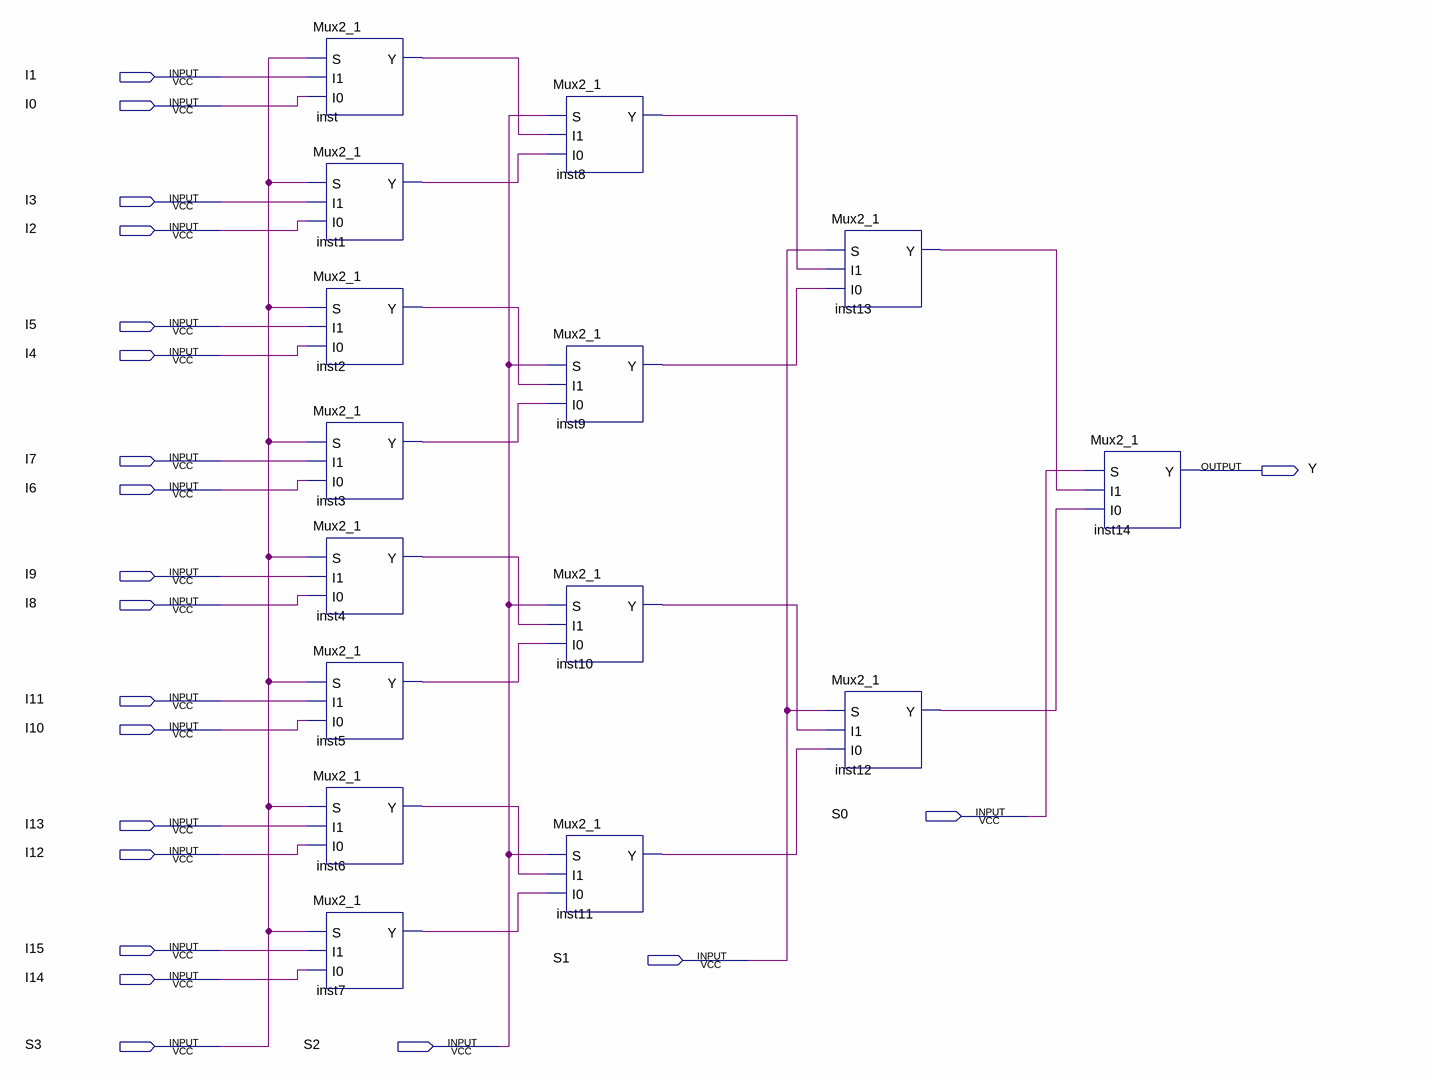
[diagram p0: schematic sheet]
// Quartus schematic Mux16_1.bdf as structural Verilog: 15 symbols, 21 pins
module Mux16_1 (
  input  I1,
  input  I0,
  input  I3,
  input  I2,
  input  I5,
  input  I4,
  input  I7,
  input  I6,
  input  I9,
  input  I8,
  input  I11,
  input  I10,
  input  S0,
  input  I13,
  input  I12,
  input  I15,
  input  S1,
  input  I14,
  input  S3,
  input  S2,
  output Y
);

  wire inst1_y, inst2_y, inst3_y, inst4_y, inst5_y, inst6_y, inst7_y, inst8_y, inst9_y, inst10_y, inst11_y,
       inst12_y, inst13_y, inst_y;

  Mux2_1 inst (.S(S3), .I1(I1), .I0(I0), .Y(inst_y));
  Mux2_1 inst1 (.S(S3), .I1(I3), .I0(I2), .Y(inst1_y));
  Mux2_1 inst2 (.S(S3), .I1(I5), .I0(I4), .Y(inst2_y));
  Mux2_1 inst3 (.S(S3), .I1(I7), .I0(I6), .Y(inst3_y));
  Mux2_1 inst4 (.S(S3), .I1(I9), .I0(I8), .Y(inst4_y));
  Mux2_1 inst5 (.S(S3), .I1(I11), .I0(I10), .Y(inst5_y));
  Mux2_1 inst6 (.S(S3), .I1(I13), .I0(I12), .Y(inst6_y));
  Mux2_1 inst7 (.S(S3), .I1(I15), .I0(I14), .Y(inst7_y));
  Mux2_1 inst8 (.S(S2), .I1(inst_y), .I0(inst1_y), .Y(inst8_y));
  Mux2_1 inst9 (.S(S2), .I1(inst2_y), .I0(inst3_y), .Y(inst9_y));
  Mux2_1 inst10 (.S(S2), .I1(inst4_y), .I0(inst5_y), .Y(inst10_y));
  Mux2_1 inst11 (.S(S2), .I1(inst6_y), .I0(inst7_y), .Y(inst11_y));
  Mux2_1 inst13 (.S(S1), .I1(inst8_y), .I0(inst9_y), .Y(inst13_y));
  Mux2_1 inst12 (.S(S1), .I1(inst10_y), .I0(inst11_y), .Y(inst12_y));
  Mux2_1 inst14 (.S(S0), .I1(inst13_y), .I0(inst12_y), .Y(Y));
endmodule
